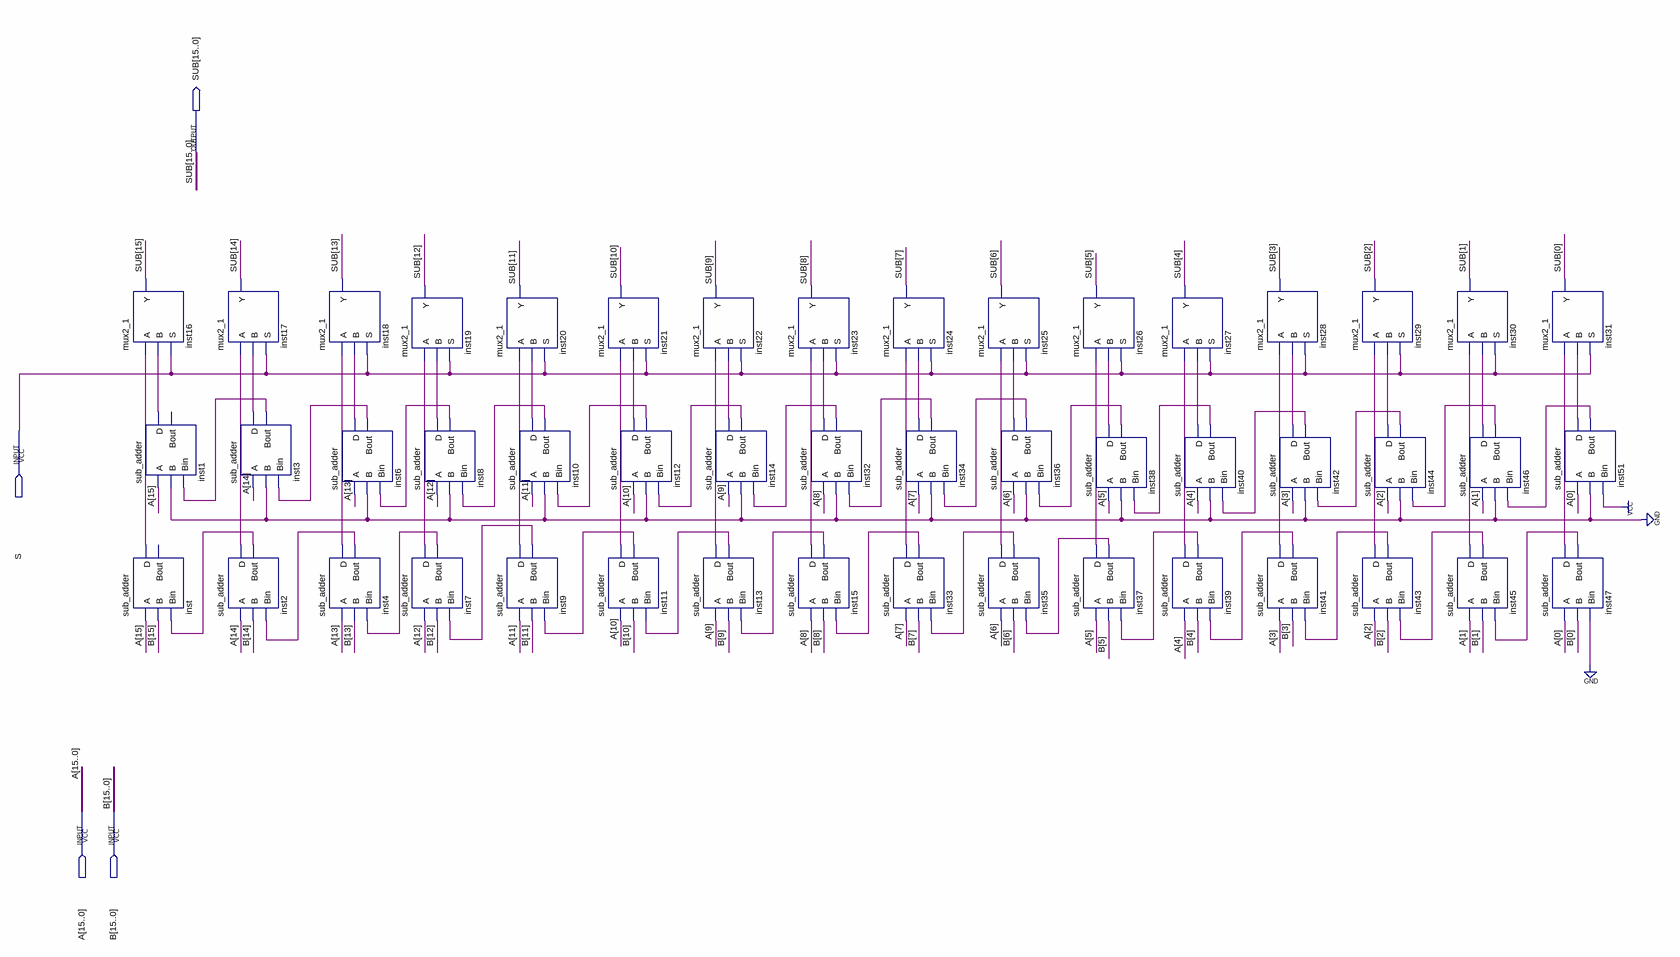
[diagram p0: schematic sheet]
// Quartus schematic full_sub_16bit.bdf as structural Verilog: 48 symbols, 4 pins
module full_sub_16bit (
  input  S,
  input  [15:0] A,
  input  [15:0] B,
  output [15:0] SUB
);

  wire inst1_d, inst2_bout, inst2_d, inst3_bout, inst3_d, inst4_bout, inst4_d, inst6_bout, inst6_d,
       inst7_bout, inst7_d, inst8_bout, inst8_d, inst9_bout, inst9_d, inst10_bout, inst10_d, inst11_bout,
       inst11_d, inst12_bout, inst12_d, inst13_bout, inst13_d, inst14_bout, inst14_d, inst15_bout, inst15_d,
       inst32_bout, inst32_d, inst33_bout, inst33_d, inst34_bout, inst34_d, inst35_bout, inst35_d,
       inst36_bout, inst36_d, inst37_bout, inst37_d, inst38_bout, inst38_d, inst39_bout, inst39_d,
       inst40_bout, inst40_d, inst41_bout, inst41_d, inst42_bout, inst42_d, inst43_bout, inst43_d,
       inst44_bout, inst44_d, inst45_bout, inst45_d, inst46_bout, inst46_d, inst47_bout, inst47_d,
       inst51_bout, inst51_d, inst_d;

  mux2_1 inst16 (.A(inst_d), .B(inst1_d), .S(S), .Y(SUB[15]));
  sub_adder inst1 (.A(A[15]), .B(1'b0), .Bin(inst3_bout), .D(inst1_d));  // open: Bout
  sub_adder inst (.A(A[15]), .B(B[15]), .Bin(inst2_bout), .D(inst_d));  // open: Bout
  mux2_1 inst17 (.A(inst2_d), .B(inst3_d), .S(S), .Y(SUB[14]));
  sub_adder inst3 (.A(A[14]), .B(1'b0), .Bin(inst6_bout), .D(inst3_d), .Bout(inst3_bout));
  sub_adder inst2 (.A(A[14]), .B(B[14]), .Bin(inst4_bout), .D(inst2_d), .Bout(inst2_bout));
  mux2_1 inst18 (.A(inst4_d), .B(inst6_d), .S(S), .Y(SUB[13]));
  sub_adder inst6 (.A(A[13]), .B(1'b0), .Bin(inst8_bout), .D(inst6_d), .Bout(inst6_bout));
  sub_adder inst4 (.A(A[13]), .B(B[13]), .Bin(inst7_bout), .D(inst4_d), .Bout(inst4_bout));
  mux2_1 inst19 (.A(inst7_d), .B(inst8_d), .S(S), .Y(SUB[12]));
  sub_adder inst8 (.A(A[12]), .B(1'b0), .Bin(inst10_bout), .D(inst8_d), .Bout(inst8_bout));
  sub_adder inst7 (.A(A[12]), .B(B[12]), .Bin(inst9_bout), .D(inst7_d), .Bout(inst7_bout));
  mux2_1 inst20 (.A(inst9_d), .B(inst10_d), .S(S), .Y(SUB[11]));
  sub_adder inst10 (.A(A[11]), .B(1'b0), .Bin(inst12_bout), .D(inst10_d), .Bout(inst10_bout));
  sub_adder inst9 (.A(A[11]), .B(B[11]), .Bin(inst11_bout), .D(inst9_d), .Bout(inst9_bout));
  mux2_1 inst21 (.A(inst11_d), .B(inst12_d), .S(S), .Y(SUB[10]));
  sub_adder inst12 (.A(A[10]), .B(1'b0), .Bin(inst14_bout), .D(inst12_d), .Bout(inst12_bout));
  sub_adder inst11 (.A(A[10]), .B(B[10]), .Bin(inst13_bout), .D(inst11_d), .Bout(inst11_bout));
  mux2_1 inst22 (.A(inst13_d), .B(inst14_d), .S(S), .Y(SUB[9]));
  sub_adder inst14 (.A(A[9]), .B(1'b0), .Bin(inst32_bout), .D(inst14_d), .Bout(inst14_bout));
  sub_adder inst13 (.A(A[9]), .B(B[9]), .Bin(inst15_bout), .D(inst13_d), .Bout(inst13_bout));
  mux2_1 inst23 (.A(inst15_d), .B(inst32_d), .S(S), .Y(SUB[8]));
  sub_adder inst32 (.A(A[8]), .B(1'b0), .Bin(inst34_bout), .D(inst32_d), .Bout(inst32_bout));
  sub_adder inst15 (.A(A[8]), .B(B[8]), .Bin(inst33_bout), .D(inst15_d), .Bout(inst15_bout));
  mux2_1 inst24 (.A(inst33_d), .B(inst34_d), .S(S), .Y(SUB[7]));
  sub_adder inst34 (.A(A[7]), .B(1'b0), .Bin(inst36_bout), .D(inst34_d), .Bout(inst34_bout));
  sub_adder inst33 (.A(A[7]), .B(B[7]), .Bin(inst35_bout), .D(inst33_d), .Bout(inst33_bout));
  mux2_1 inst25 (.A(inst35_d), .B(inst36_d), .S(S), .Y(SUB[6]));
  sub_adder inst36 (.A(A[6]), .B(1'b0), .Bin(inst38_bout), .D(inst36_d), .Bout(inst36_bout));
  sub_adder inst35 (.A(A[6]), .B(B[6]), .Bin(inst37_bout), .D(inst35_d), .Bout(inst35_bout));
  mux2_1 inst26 (.A(inst37_d), .B(inst38_d), .S(S), .Y(SUB[5]));
  sub_adder inst37 (.A(A[5]), .B(B[5]), .Bin(inst39_bout), .D(inst37_d), .Bout(inst37_bout));
  sub_adder inst38 (.A(A[5]), .B(1'b0), .Bin(inst40_bout), .D(inst38_d), .Bout(inst38_bout));
  mux2_1 inst27 (.A(inst39_d), .B(inst40_d), .S(S), .Y(SUB[4]));
  sub_adder inst40 (.A(A[4]), .B(1'b0), .Bin(inst42_bout), .D(inst40_d), .Bout(inst40_bout));
  sub_adder inst39 (.A(A[4]), .B(B[4]), .Bin(inst41_bout), .D(inst39_d), .Bout(inst39_bout));
  mux2_1 inst28 (.A(inst41_d), .B(inst42_d), .S(S), .Y(SUB[3]));
  sub_adder inst42 (.A(A[3]), .B(1'b0), .Bin(inst44_bout), .D(inst42_d), .Bout(inst42_bout));
  sub_adder inst41 (.A(A[3]), .B(B[3]), .Bin(inst43_bout), .D(inst41_d), .Bout(inst41_bout));
  mux2_1 inst29 (.A(inst43_d), .B(inst44_d), .S(S), .Y(SUB[2]));
  sub_adder inst44 (.A(A[2]), .B(1'b0), .Bin(inst46_bout), .D(inst44_d), .Bout(inst44_bout));
  sub_adder inst43 (.A(A[2]), .B(B[2]), .Bin(inst45_bout), .D(inst43_d), .Bout(inst43_bout));
  mux2_1 inst30 (.A(inst45_d), .B(inst46_d), .S(S), .Y(SUB[1]));
  sub_adder inst46 (.A(A[1]), .B(1'b0), .Bin(inst51_bout), .D(inst46_d), .Bout(inst46_bout));
  sub_adder inst45 (.A(A[1]), .B(B[1]), .Bin(inst47_bout), .D(inst45_d), .Bout(inst45_bout));
  mux2_1 inst31 (.A(inst47_d), .B(inst51_d), .S(S), .Y(SUB[0]));
  sub_adder inst51 (.A(A[0]), .B(1'b0), .Bin(1'b1), .D(inst51_d), .Bout(inst51_bout));
  sub_adder inst47 (.A(A[0]), .B(B[0]), .Bin(1'b0), .D(inst47_d), .Bout(inst47_bout));
endmodule
